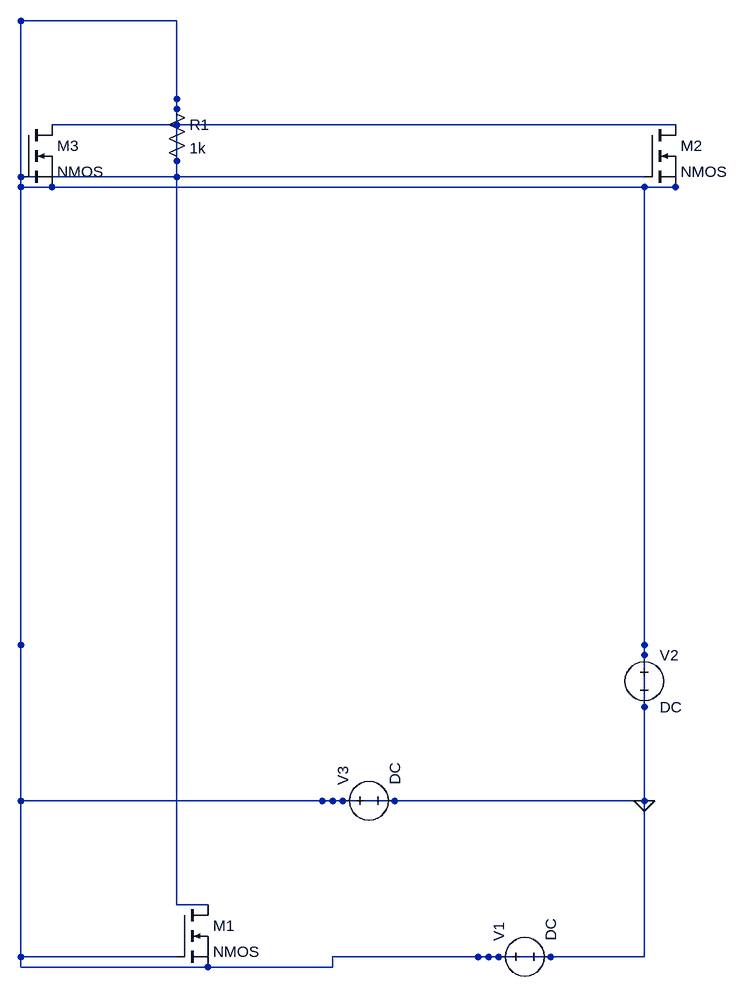
[diagram p0: schematic mosfet_test.asc]
mosfet_test.asc, the LTspice schematic file:
Version 4
SHEET 1 680 480
SYMBOL voltage 1200 1920 R270
SYMATTR InstName V1
SYMATTR Value DC
FLAG 1440 1680 0
SYMBOL voltage 1440 1440 R0
SYMATTR InstName V2
SYMATTR Value DC
SYMBOL voltage 960 1680 R270
SYMATTR InstName V3
SYMATTR Value DC
SYMBOL nmos 720 1840 R0
SYMATTR InstName M1
SYMATTR Value NMOS
SYMBOL nmos 1440 640 R0
SYMATTR InstName M2
SYMATTR Value NMOS
SYMBOL nmos 480 640 R0
SYMATTR InstName M3
SYMATTR Value NMOS
SYMBOL res 704 600 R0
SYMATTR InstName R1
SYMATTR Value 1k
WIRE 960 1920 1200 1920
WIRE 1440 1440 1440 1680
WIRE 1440 960 1440 1456
WIRE 944 1680 1440 1680
WIRE 720 600 720 720
WIRE 1440 1920 1184 1920
WIRE 1440 1920 1440 1680
WIRE 480 1680 960 1680
WIRE 480 1680 480 1440
WIRE 720 480 480 480
WIRE 720 480 720 616
WIRE 768 1840 720 1840
WIRE 720 1840 720 720
WIRE 720 1920 480 1920
WIRE 480 1920 480 480
WIRE 768 1936 480 1936
WIRE 480 1936 480 480
WIRE 768 1936 960 1936
WIRE 960 1936 960 1920
WIRE 1488 640 720 640
WIRE 720 640 720 720
WIRE 1440 720 480 720
WIRE 480 720 480 480
WIRE 1488 736 480 736
WIRE 480 736 480 480
WIRE 1488 736 1440 736
WIRE 1440 736 1440 960
WIRE 528 640 720 640
WIRE 720 640 720 720
WIRE 480 720 480 480
WIRE 528 736 480 736
WIRE 480 736 480 480
WIRE 528 736 480 736
WIRE 480 736 480 1440

The netlist it stands for:
* mosfet_test.asc
V1 0 0 DC
V2 0 0 DC
V3 0 0 DC
M1 0 0 0 0 NMOS
M2 0 0 0 0 NMOS
M3 0 0 0 0 NMOS
R1 0 0 1k
.model NMOS NMOS
.model PMOS PMOS
.lib standard.mos
.backanno
.end